# Altium schematic sheet seven_segment_displays.SchDoc
size A3; SheetNumber: 12; SheetTotal: 18; SPICEModelCacheAGOJJZQO: <root> / <DocumentId>AGOJJZQO</DocumentId> / </root>
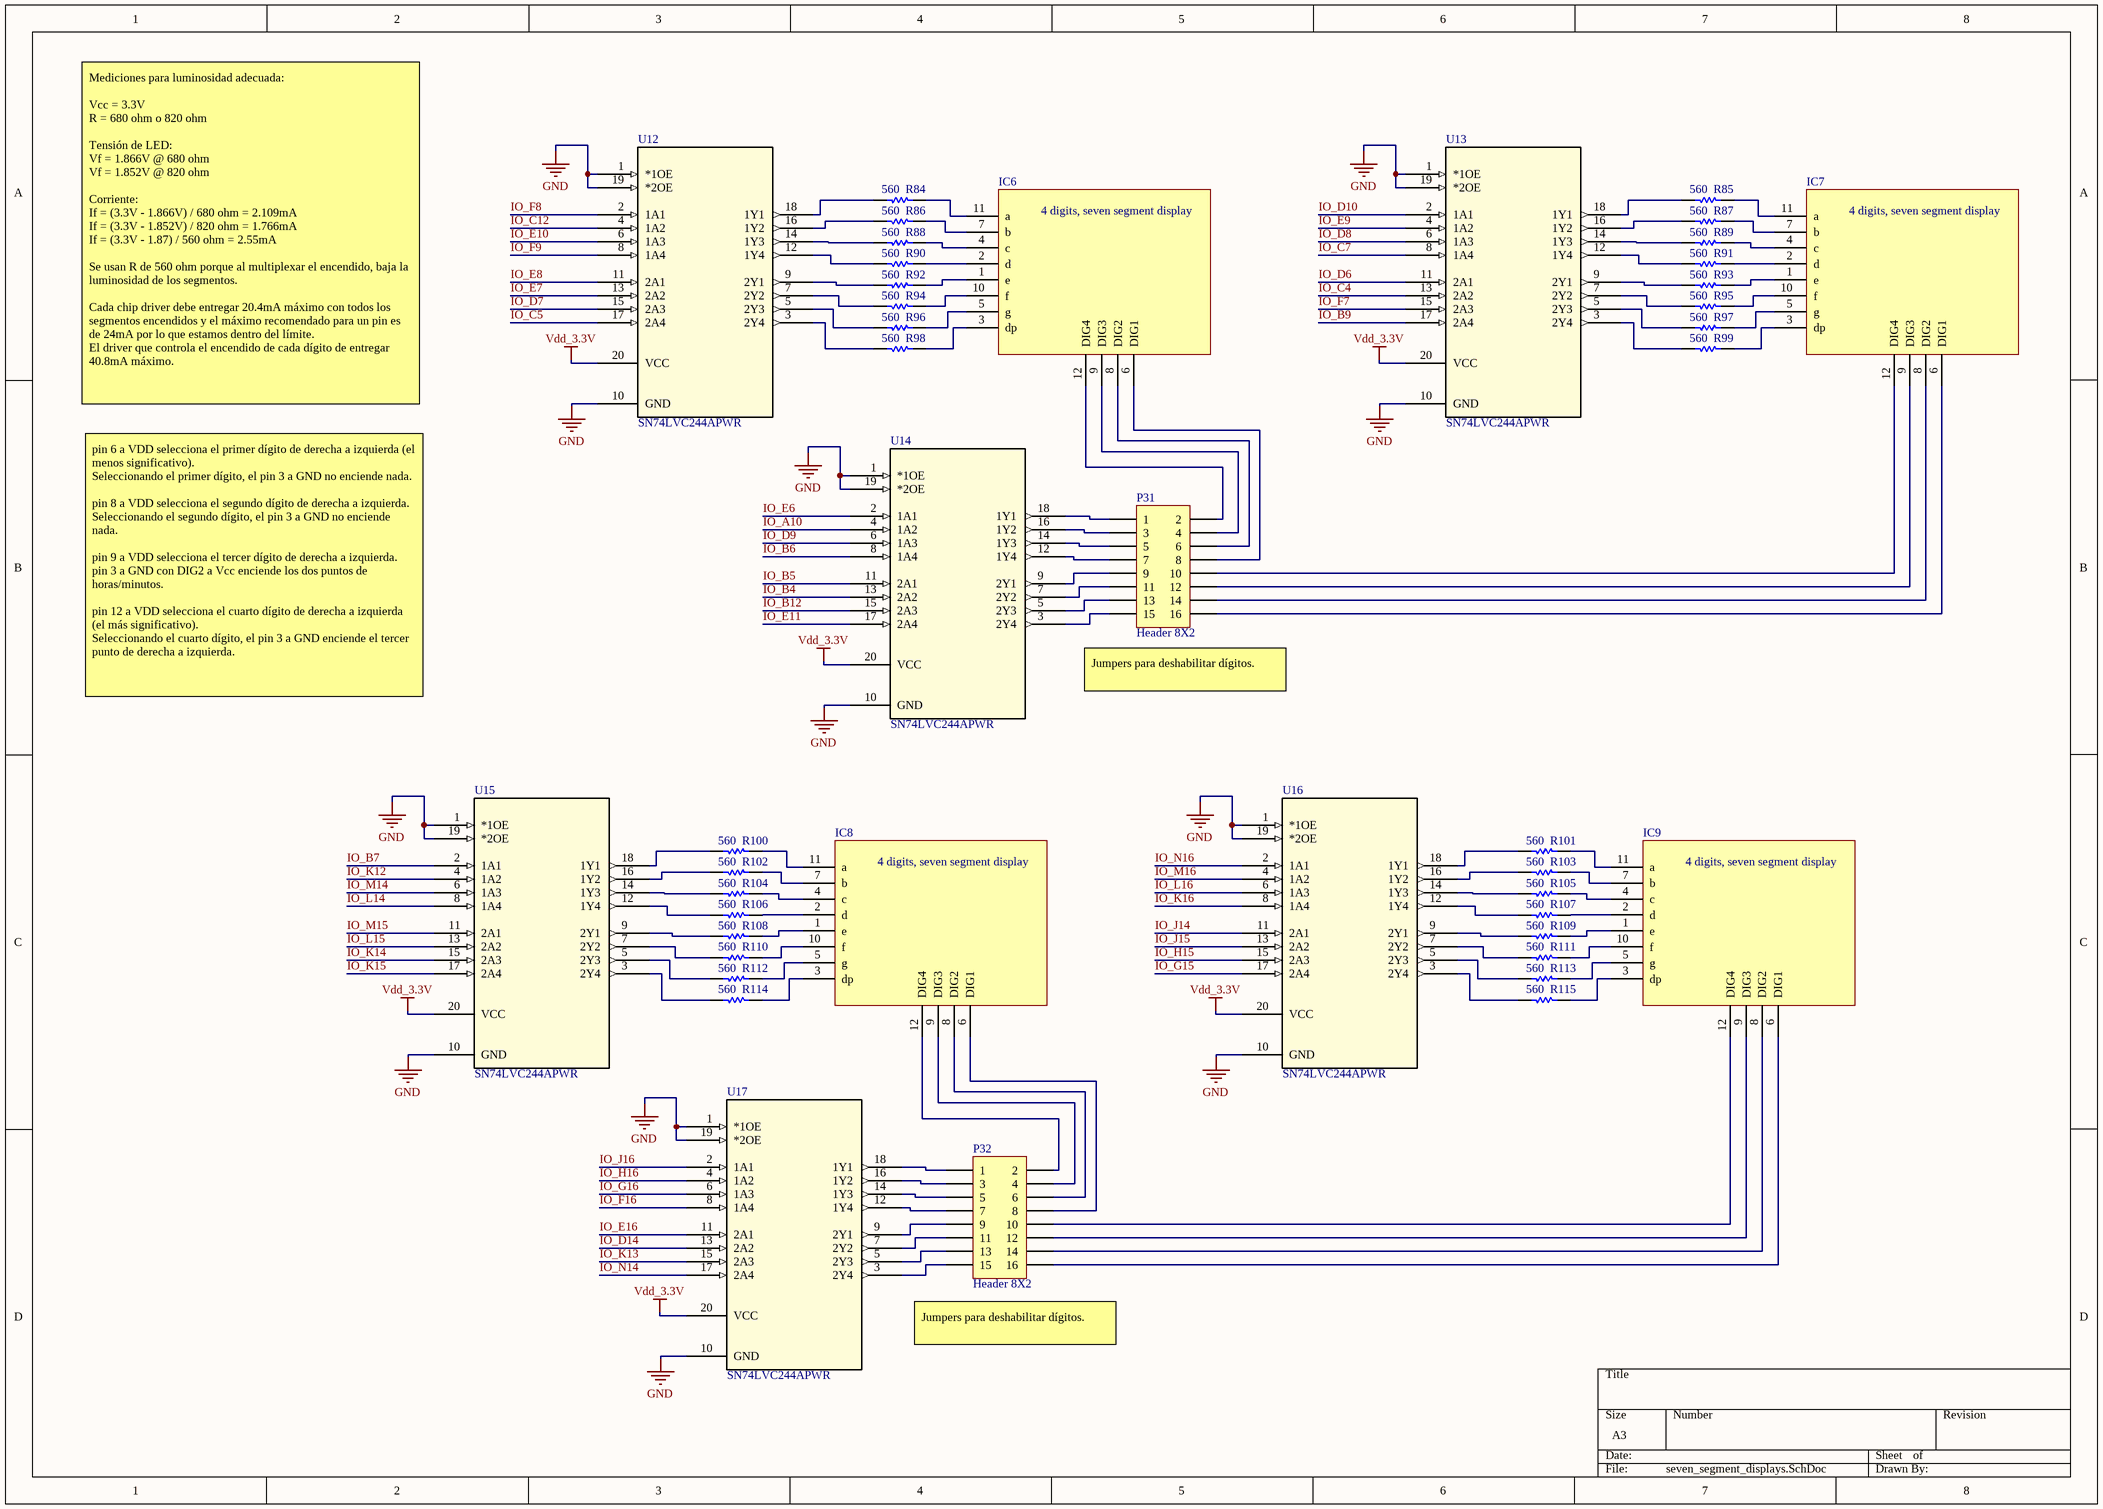
[diagram p0: seven_segment_displays.SchDoc]

## Parts
IC6  Seven segment display x 4 digits  [4 digit, seven segment display / 50.3mm x 19mm]  (value not drawn)
IC7  Seven segment display x 4 digits  [4 digit, seven segment display / 50.3mm x 19mm]  (value not drawn)
IC8  Seven segment display x 4 digits  [4 digit, seven segment display / 50.3mm x 19mm]  (value not drawn)
IC9  Seven segment display x 4 digits  [4 digit, seven segment display / 50.3mm x 19mm]  (value not drawn)
P31  Header 8X2  [HDR2X8]
P32  Header 8X2  [HDR2X8]
R84  value 560  [resistor 0603]  (hidden comment: resistor)
R85  value 560  [resistor 0603]  (hidden comment: resistor)
R86  value 560  [resistor 0603]  (hidden comment: resistor)
R87  value 560  [resistor 0603]  (hidden comment: resistor)
R88  value 560  [resistor 0603]  (hidden comment: resistor)
R89  value 560  [resistor 0603]  (hidden comment: resistor)
R90  value 560  [resistor 0603]  (hidden comment: resistor)
R91  value 560  [resistor 0603]  (hidden comment: resistor)
R92  value 560  [resistor 0603]  (hidden comment: resistor)
R93  value 560  [resistor 0603]  (hidden comment: resistor)
R94  value 560  [resistor 0603]  (hidden comment: resistor)
R95  value 560  [resistor 0603]  (hidden comment: resistor)
R96  value 560  [resistor 0603]  (hidden comment: resistor)
R97  value 560  [resistor 0603]  (hidden comment: resistor)
R98  value 560  [resistor 0603]  (hidden comment: resistor)
R99  value 560  [resistor 0603]  (hidden comment: resistor)
R100  value 560  [resistor 0603]  (hidden comment: resistor)
R101  value 560  [resistor 0603]  (hidden comment: resistor)
R102  value 560  [resistor 0603]  (hidden comment: resistor)
R103  value 560  [resistor 0603]  (hidden comment: resistor)
R104  value 560  [resistor 0603]  (hidden comment: resistor)
R105  value 560  [resistor 0603]  (hidden comment: resistor)
R106  value 560  [resistor 0603]  (hidden comment: resistor)
R107  value 560  [resistor 0603]  (hidden comment: resistor)
R108  value 560  [resistor 0603]  (hidden comment: resistor)
R109  value 560  [resistor 0603]  (hidden comment: resistor)
R110  value 560  [resistor 0603]  (hidden comment: resistor)
R111  value 560  [resistor 0603]  (hidden comment: resistor)
R112  value 560  [resistor 0603]  (hidden comment: resistor)
R113  value 560  [resistor 0603]  (hidden comment: resistor)
R114  value 560  [resistor 0603]  (hidden comment: resistor)
R115  value 560  [resistor 0603]  (hidden comment: resistor)
U12  SN74LVC244APWR  [PW20]
U13  SN74LVC244APWR  [PW20]
U14  SN74LVC244APWR  [PW20]
U15  SN74LVC244APWR  [PW20]
U16  SN74LVC244APWR  [PW20]
U17  SN74LVC244APWR  [PW20]

## Nets
GND: U12.1(*1OE) U12.10(GND) U12.19(*2OE) U13.1(*1OE) U13.10(GND) U13.19(*2OE) U14.1(*1OE) U14.10(GND) U14.19(*2OE) U15.1(*1OE) U15.10(GND) U15.19(*2OE) U16.1(*1OE) U16.10(GND) U16.19(*2OE) U17.1(*1OE) U17.10(GND) U17.19(*2OE)
Vdd_3.3V: U12.20(VCC) U13.20(VCC) U14.20(VCC) U15.20(VCC) U16.20(VCC) U17.20(VCC)
IO_A10: U14.4(1A2)
IO_B4: U14.13(2A2)
IO_B5: U14.11(2A1)
IO_B6: U14.8(1A4)
IO_B7: U15.2(1A1)
IO_B9: U13.17(2A4)
IO_B12: U14.15(2A3)
IO_C4: U13.13(2A2)
IO_C5: U12.17(2A4)
IO_C7: U13.8(1A4)
IO_C12: U12.4(1A2)
IO_D6: U13.11(2A1)
IO_D7: U12.15(2A3)
IO_D8: U13.6(1A3)
IO_D9: U14.6(1A3)
IO_D10: U13.2(1A1)
IO_D14: U17.13(2A2)
IO_E6: U14.2(1A1)
IO_E7: U12.13(2A2)
IO_E8: U12.11(2A1)
IO_E9: U13.4(1A2)
IO_E10: U12.6(1A3)
IO_E11: U14.17(2A4)
IO_E16: U17.11(2A1)
IO_F7: U13.15(2A3)
IO_F8: U12.2(1A1)
IO_F9: U12.8(1A4)
IO_F16: U17.8(1A4)
IO_G15: U16.17(2A4)
IO_G16: U17.6(1A3)
IO_H15: U16.15(2A3)
IO_H16: U17.4(1A2)
IO_J14: U16.11(2A1)
IO_J15: U16.13(2A2)
IO_J16: U17.2(1A1)
IO_K12: U15.4(1A2)
IO_K13: U17.15(2A3)
IO_K14: U15.15(2A3)
IO_K15: U15.17(2A4)
IO_K16: U16.8(1A4)
IO_L14: U15.8(1A4)
IO_L15: U15.13(2A2)
IO_L16: U16.6(1A3)
IO_M14: U15.6(1A3)
IO_M15: U15.11(2A1)
IO_M16: U16.4(1A2)
IO_N14: U17.17(2A4)
IO_N16: U16.2(1A1)
NetIC6_1: IC6.1(e) R92.2
NetIC6_2: IC6.2(d) R90.2
NetIC6_3: IC6.3(dp) R98.2
NetIC6_4: IC6.4(c) R88.2
NetIC6_5: IC6.5(g) R96.2
NetIC6_6: IC6.6(DIG1) P31.8
NetIC6_7: IC6.7(b) R86.2
NetIC6_8: IC6.8(DIG2) P31.6
NetIC6_9: IC6.9(DIG3) P31.4
NetIC6_10: IC6.10(f) R94.2
NetIC6_11: IC6.11(a) R84.2
NetIC6_12: IC6.12(DIG4) P31.2
NetIC7_1: IC7.1(e) R93.2
NetIC7_2: IC7.2(d) R91.2
NetIC7_3: IC7.3(dp) R99.2
NetIC7_4: IC7.4(c) R89.2
NetIC7_5: IC7.5(g) R97.2
NetIC7_6: IC7.6(DIG1) P31.16
NetIC7_7: IC7.7(b) R87.2
NetIC7_8: IC7.8(DIG2) P31.14
NetIC7_9: IC7.9(DIG3) P31.12
NetIC7_10: IC7.10(f) R95.2
NetIC7_11: IC7.11(a) R85.2
NetIC7_12: IC7.12(DIG4) P31.10
NetIC8_1: IC8.1(e) R108.2
NetIC8_2: IC8.2(d) R106.2
NetIC8_3: IC8.3(dp) R114.2
NetIC8_4: IC8.4(c) R104.2
NetIC8_5: IC8.5(g) R112.2
NetIC8_6: IC8.6(DIG1) P32.8
NetIC8_7: IC8.7(b) R102.2
NetIC8_8: IC8.8(DIG2) P32.6
NetIC8_9: IC8.9(DIG3) P32.4
NetIC8_10: IC8.10(f) R110.2
NetIC8_11: IC8.11(a) R100.2
NetIC8_12: IC8.12(DIG4) P32.2
NetIC9_1: IC9.1(e) R109.2
NetIC9_2: IC9.2(d) R107.2
NetIC9_3: IC9.3(dp) R115.2
NetIC9_4: IC9.4(c) R105.2
NetIC9_5: IC9.5(g) R113.2
NetIC9_6: IC9.6(DIG1) P32.16
NetIC9_7: IC9.7(b) R103.2
NetIC9_8: IC9.8(DIG2) P32.14
NetIC9_9: IC9.9(DIG3) P32.12
NetIC9_10: IC9.10(f) R111.2
NetIC9_11: IC9.11(a) R101.2
NetIC9_12: IC9.12(DIG4) P32.10
NetP31_1: P31.1 U14.18(1Y1)
NetP31_3: P31.3 U14.16(1Y2)
NetP31_5: P31.5 U14.14(1Y3)
NetP31_7: P31.7 U14.12(1Y4)
NetP31_9: P31.9 U14.9(2Y1)
NetP31_11: P31.11 U14.7(2Y2)
NetP31_13: P31.13 U14.5(2Y3)
NetP31_15: P31.15 U14.3(2Y4)
NetP32_1: P32.1 U17.18(1Y1)
NetP32_3: P32.3 U17.16(1Y2)
NetP32_5: P32.5 U17.14(1Y3)
NetP32_7: P32.7 U17.12(1Y4)
NetP32_9: P32.9 U17.9(2Y1)
NetP32_11: P32.11 U17.7(2Y2)
NetP32_13: P32.13 U17.5(2Y3)
NetP32_15: P32.15 U17.3(2Y4)
NetR84_1: R84.1 U12.18(1Y1)
NetR85_1: R85.1 U13.18(1Y1)
NetR86_1: R86.1 U12.16(1Y2)
NetR87_1: R87.1 U13.16(1Y2)
NetR88_1: R88.1 U12.14(1Y3)
NetR89_1: R89.1 U13.14(1Y3)
NetR90_1: R90.1 U12.12(1Y4)
NetR91_1: R91.1 U13.12(1Y4)
NetR92_1: R92.1 U12.9(2Y1)
NetR93_1: R93.1 U13.9(2Y1)
NetR94_1: R94.1 U12.7(2Y2)
NetR95_1: R95.1 U13.7(2Y2)
NetR96_1: R96.1 U12.5(2Y3)
NetR97_1: R97.1 U13.5(2Y3)
NetR98_1: R98.1 U12.3(2Y4)
NetR99_1: R99.1 U13.3(2Y4)
NetR100_1: R100.1 U15.18(1Y1)
NetR101_1: R101.1 U16.18(1Y1)
NetR102_1: R102.1 U15.16(1Y2)
NetR103_1: R103.1 U16.16(1Y2)
NetR104_1: R104.1 U15.14(1Y3)
NetR105_1: R105.1 U16.14(1Y3)
NetR106_1: R106.1 U15.12(1Y4)
NetR107_1: R107.1 U16.12(1Y4)
NetR108_1: R108.1 U15.9(2Y1)
NetR109_1: R109.1 U16.9(2Y1)
NetR110_1: R110.1 U15.7(2Y2)
NetR111_1: R111.1 U16.7(2Y2)
NetR112_1: R112.1 U15.5(2Y3)
NetR113_1: R113.1 U16.5(2Y3)
NetR114_1: R114.1 U15.3(2Y4)
NetR115_1: R115.1 U16.3(2Y4)

## Notes on the sheet
- Mediciones para luminosidad adecuada:
  Vcc = 3.3V
  R = 680 ohm o 820 ohm
  Tensión de LED:
  Vf = 1.866V @ 680 ohm
  Vf = 1.852V @ 820 ohm
  Corriente:
  If = (3.3V - 1.866V) / 680 ohm = 2.109mA
  If = (3.3V - 1.852V) / 820 ohm = 1.766mA
  If = (3.3V - 1.87) / 560 ohm = 2.55mA
  Se usan R de 560 ohm porque al multiplexar el encendido, baja la luminosidad de los segmentos.
  Cada chip driver debe entregar 20.4mA máximo con todos los segmentos encendidos y el máximo recomendado para un pin es de 24mA por lo que estamos dentro del límite.
  El driver que controla el encendido de cada dígito de entregar 40.8mA máximo.
- pin 6 a VDD selecciona el primer dígito de derecha a izquierda (el menos significativo).
  Seleccionando el primer dígito, el pin 3 a GND no enciende nada.
  pin 8 a VDD selecciona el segundo dígito de derecha a izquierda.
  Seleccionando el segundo dígito, el pin 3 a GND no enciende nada.
  pin 9 a VDD selecciona el tercer dígito de derecha a izquierda.
  pin 3 a GND con DIG2 a Vcc enciende los dos puntos de horas/minutos.
  pin 12 a VDD selecciona el cuarto dígito de derecha a izquierda (el más significativo).
  Seleccionando el cuarto dígito, el pin 3 a GND enciende el tercer punto de derecha a izquierda.
- (near P31) Jumpers para deshabilitar dígitos.
- Jumpers para deshabilitar dígitos.
- (in symbol Seven segment display x 4 digits) 4 digits, seven segment display

## Library data of the parts
IC6-IC9 = Seven segment display x 4 digits: Seven segment display x 4 digits with 4 decimal points and hours/minutes divider.
P31 P32 = Header 8X2: Header, 8-Pin, Dual row; LatestRevisionDate: 17-Jul-2002; LatestRevisionNote: Re-released for DXP Platform.; Publisher: Altium Limited
U12-U17 = SN74LVC244APWR: 8-ch, 1.65-V to 3.6-V buffers with 3-state outputs 20-TSSOP -40 to 125; Manufacturer_Name: Texas Instruments; Copyright: Copyright (C) 2026 Ultra Librarian. All rights reserved.; Manufacturer_Part_Number: SN74LVC244APWR; Datasheet: https://www.ti.com/lit/gpn/sn74lvc244a; RefDes: RefDes; Type: Type
R84-R115 = resistor: Package: 0603